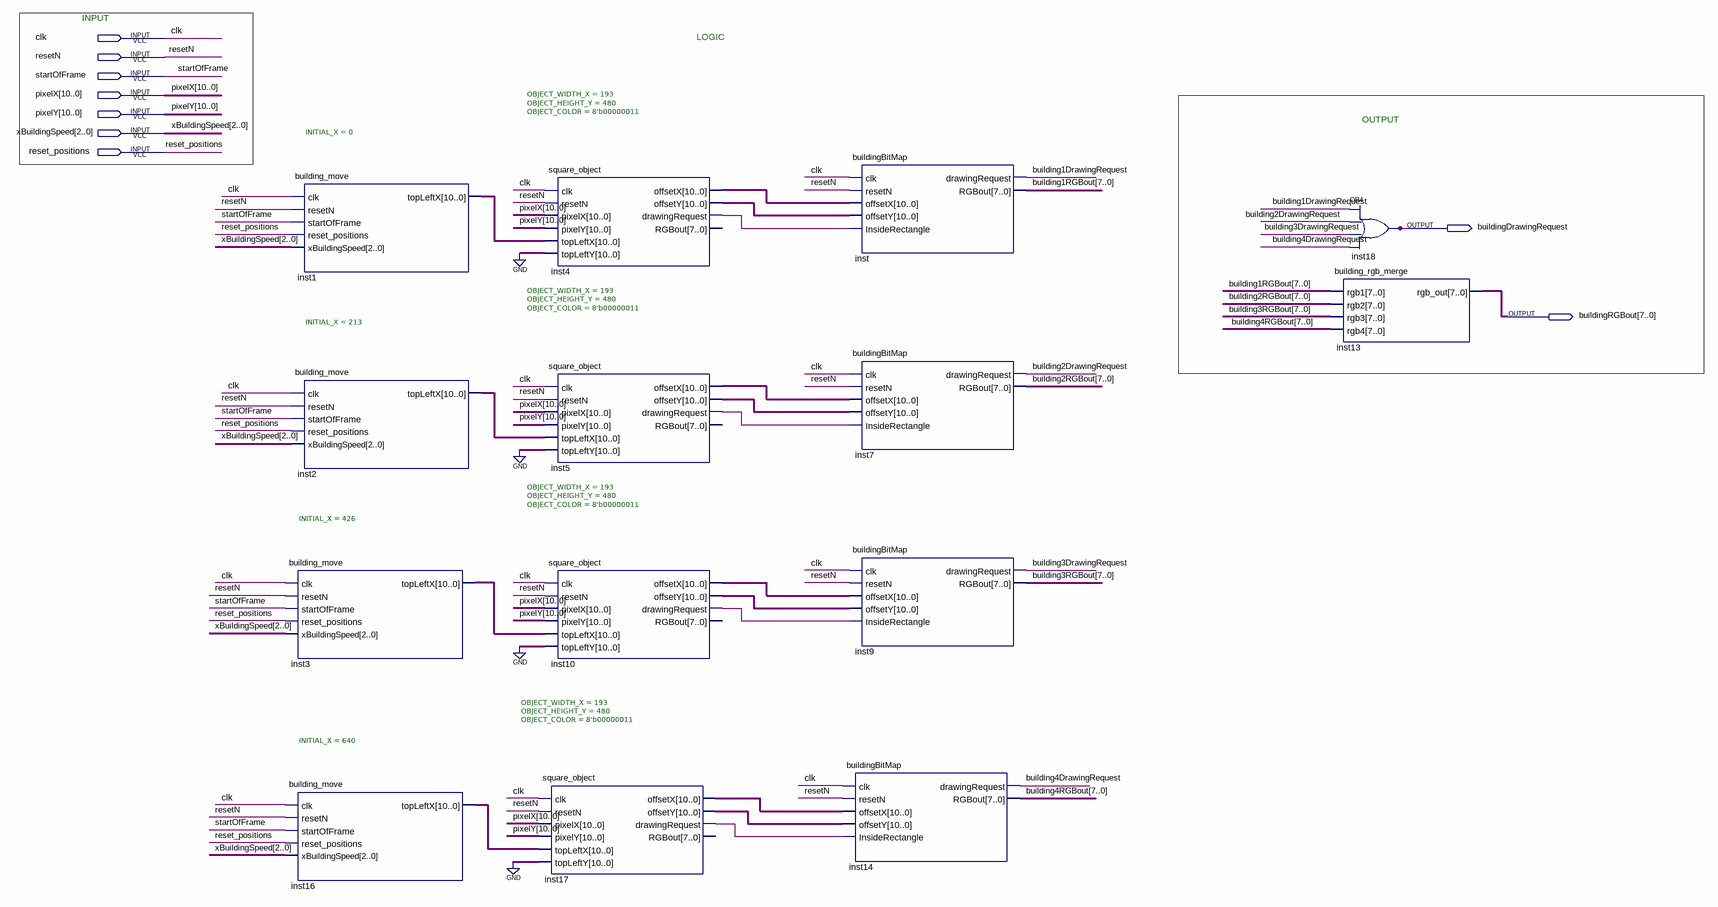
[diagram p0: schematic sheet]
// Quartus schematic BUILDING_DISPLAY.bdf as structural Verilog: 14 symbols, 9 pins
module BUILDING_DISPLAY (
  input  clk,
  input  resetN,
  input  startOfFrame,
  input  [10:0] pixelX,
  input  [10:0] pixelY,
  input  [2:0] xBuildingSpeed,
  input  reset_positions,
  output buildingDrawingRequest,
  output [7:0] buildingRGBout
);

  wire building1DrawingRequest, building2DrawingRequest, building3DrawingRequest, building4DrawingRequest,
       inst4_drawingrequest, inst5_drawingrequest, inst10_drawingrequest, inst17_drawingrequest;
  wire [7:0] building1RGBout, building2RGBout, building3RGBout, building4RGBout;
  wire [10:0] inst1_topleftx, inst2_topleftx, inst3_topleftx, inst4_offsetx, inst4_offsety, inst5_offsetx,
       inst5_offsety, inst10_offsetx, inst10_offsety, inst16_topleftx, inst17_offsetx, inst17_offsety;

  building_move #(.INITIAL_X(0)) inst1 (
    .clk(clk), .resetN(resetN), .startOfFrame(startOfFrame), .reset_positions(reset_positions),
    .xBuildingSpeed(xBuildingSpeed), .topLeftX(inst1_topleftx));
  building_move #(.INITIAL_X(213)) inst2 (
    .clk(clk), .resetN(resetN), .startOfFrame(startOfFrame), .reset_positions(reset_positions),
    .xBuildingSpeed(xBuildingSpeed), .topLeftX(inst2_topleftx));
  building_move #(.INITIAL_X(426)) inst3 (
    .clk(clk), .resetN(resetN), .startOfFrame(startOfFrame), .reset_positions(reset_positions),
    .xBuildingSpeed(xBuildingSpeed), .topLeftX(inst3_topleftx));
  building_move #(.INITIAL_X(640)) inst16 (
    .clk(clk), .resetN(resetN), .startOfFrame(startOfFrame), .reset_positions(reset_positions),
    .xBuildingSpeed(xBuildingSpeed), .topLeftX(inst16_topleftx));
  square_object #(.OBJECT_WIDTH_X(193), .OBJECT_HEIGHT_Y(480), .OBJECT_COLOR(8'b00000011)) inst4 (
    .clk(clk), .resetN(resetN), .pixelX(pixelX), .pixelY(pixelY), .topLeftX(inst1_topleftx),
    .topLeftY({11{1'b0}}), .offsetX(inst4_offsetx), .offsetY(inst4_offsety),
    .drawingRequest(inst4_drawingrequest));  // open: RGBout
  square_object #(.OBJECT_WIDTH_X(193), .OBJECT_HEIGHT_Y(480), .OBJECT_COLOR(8'b00000011)) inst5 (
    .clk(clk), .resetN(resetN), .pixelX(pixelX), .pixelY(pixelY), .topLeftX(inst2_topleftx),
    .topLeftY({11{1'b0}}), .offsetX(inst5_offsetx), .offsetY(inst5_offsety),
    .drawingRequest(inst5_drawingrequest));  // open: RGBout
  square_object #(.OBJECT_WIDTH_X(193), .OBJECT_HEIGHT_Y(480), .OBJECT_COLOR(8'b00000011)) inst10 (
    .clk(clk), .resetN(resetN), .pixelX(pixelX), .pixelY(pixelY), .topLeftX(inst3_topleftx),
    .topLeftY({11{1'b0}}), .offsetX(inst10_offsetx), .offsetY(inst10_offsety),
    .drawingRequest(inst10_drawingrequest));  // open: RGBout
  square_object #(.OBJECT_WIDTH_X(193), .OBJECT_HEIGHT_Y(480), .OBJECT_COLOR(8'b00000011)) inst17 (
    .clk(clk), .resetN(resetN), .pixelX(pixelX), .pixelY(pixelY), .topLeftX(inst16_topleftx),
    .topLeftY({11{1'b0}}), .offsetX(inst17_offsetx), .offsetY(inst17_offsety),
    .drawingRequest(inst17_drawingrequest));  // open: RGBout
  buildingBitMap inst (
    .clk(clk), .resetN(resetN), .offsetX(inst4_offsetx), .offsetY(inst4_offsety),
    .InsideRectangle(inst4_drawingrequest), .drawingRequest(building1DrawingRequest), .RGBout(building1RGBout));
  buildingBitMap inst7 (
    .clk(clk), .resetN(resetN), .offsetX(inst5_offsetx), .offsetY(inst5_offsety),
    .InsideRectangle(inst5_drawingrequest), .drawingRequest(building2DrawingRequest), .RGBout(building2RGBout));
  buildingBitMap inst9 (
    .clk(clk), .resetN(resetN), .offsetX(inst10_offsetx), .offsetY(inst10_offsety),
    .InsideRectangle(inst10_drawingrequest), .drawingRequest(building3DrawingRequest),
    .RGBout(building3RGBout));
  buildingBitMap inst14 (
    .clk(clk), .resetN(resetN), .offsetX(inst17_offsetx), .offsetY(inst17_offsety),
    .InsideRectangle(inst17_drawingrequest), .drawingRequest(building4DrawingRequest),
    .RGBout(building4RGBout));
  building_rgb_merge inst13 (
    .rgb1(building1RGBout), .rgb2(building2RGBout), .rgb3(building3RGBout), .rgb4(building4RGBout),
    .rgb_out(buildingRGBout));
  or inst18 (buildingDrawingRequest, building1DrawingRequest, building2DrawingRequest, building3DrawingRequest, building4DrawingRequest);

  // Notes on the sheet:
  //   INPUT
  //   LOGIC
  //   OUTPUT
endmodule
